# Altium schematic sheet 3.3V regulator IC TPS5430.SchDoc
size A; SheetNumber: 1; SheetTotal: 6
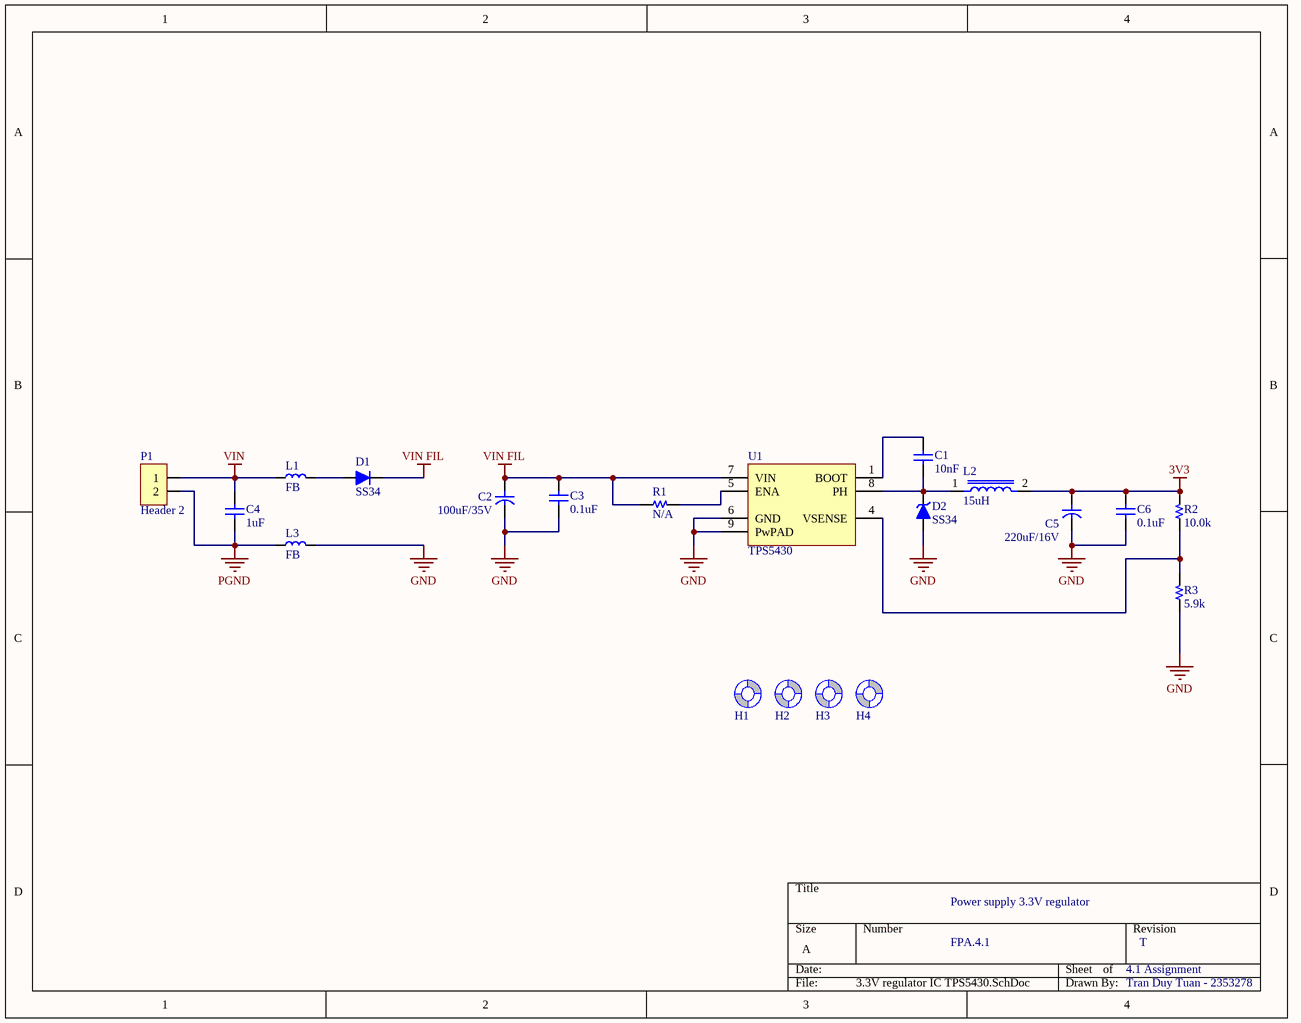
[diagram p0: 3.3V regulator IC TPS5430.SchDoc]

## Parts
C1  10nF  [C 0805]
C2  100uF/35V  [CYL/D.500/LS.200]
C3  0.1uF  [C 0805]
C4  1uF  [C 0805]
C5  220uF/16V  [CYL/D.500/LS.200]
C6  0.1uF  [C 0805]
D1  SS34  [DO-214AC (SMA)]
D2  SS34  [DO-214AC (SMA)]
H1  Screw Hole  [SCREW/3.2/7.0/M]  (value not drawn)  (no BOM)
H2  Screw Hole  [SCREW/3.2/7.0/M]  (value not drawn)  (no BOM)
H3  Screw Hole  [SCREW/3.2/7.0/M]  (value not drawn)  (no BOM)
H4  Screw Hole  [SCREW/3.2/7.0/M]  (value not drawn)  (no BOM)
L1  FB  [L 0805 (2012)]
L2  15uH  [IND_SRP6540-150M]
L3  FB  [L 0805 (2012)]
P1  Header 2  [HDR/Header/2/VH]
R1  N/A  [R 0603]
R2  10.0k  [R 0603]
R3  5.9k  [R 0603]
U1  TPS5430  [SOIC-8 EP]

## Nets
3V3: C5.1 C6.1 L2.2 R2.2
GND: C2.2 C3.2 C5.2 C6.2 D2.1(A) L3.2 R3.1 U1.6(GND) U1.9(PwPAD)
PGND: C4.2 L3.1 P1.2
VIN: C4.1 L1.1 P1.1
VIN FIL: C2.1 C3.1 D1.2(K) R1.1 U1.7(VIN)
NetC1_1: C1.1 U1.1(BOOT)
NetC1_2: C1.2 D2.2(K) L2.1 U1.8(PH)
NetD1_1: D1.1(A) L1.2
NetR1_2: R1.2 U1.5(ENA)
NetR2_1: R2.1 R3.2 U1.4(VSENSE)

Not connected (* = marked no-connect by the designer): H1 1(Screw); H2 1(Screw); H3 1(Screw); H4 1(Screw)

## Notes on the sheet
- Power supply 3.3V regulator
- FPA.4.1
- 4.1 Assignment
- T
- Tran Duy Tuan - 2353278

## Library data of the parts
C1 C3 C4 C6 = Capacitor NP: Capacitor non-pol
C2 C5 = Capacitor: Capacitor pol
D1 = Diode: Default Diode
D2 = Diode Zener: Zener Diode
L1 L3 = Inductor
L2 = SRP6540-150M: 15ÂµH Shielded Wirewound Inductor 2.9A 121mOhm Max Nonstandard; MF: Bourns; Digi-Key_Part_Number: SRP6540-150MCT-ND; Check_prices: https://www.snapeda.com/parts/SRP6540-150M/Bourns/view-part/613418/?ref=eda; Value: *; Package: Nonstandard Bourns; Purchase-URL: https://pricing.snapeda.com/search/part/SRP6540-150M/?ref=eda; MP: SRP6540-150M; SnapEDA_Link: https://www.snapeda.com/parts/SRP6540-150M/Bourns/view-part/613418/?ref=snap
P1 = Header 2: Header, 2-Pin
R1-R3 = Resistor
U1 = TPS54xx: 3/5A, Wide input range, Step-down SWIFT DC-DC Converter
H1-H4 = Screw Hole: TYPE: NO-BOM; UNIT PRICE: 0